# Altium schematic sheet DebugBoard5VMux.SchDoc
size 420 x 297 mm; SheetNumber: 2; SheetTotal: 2
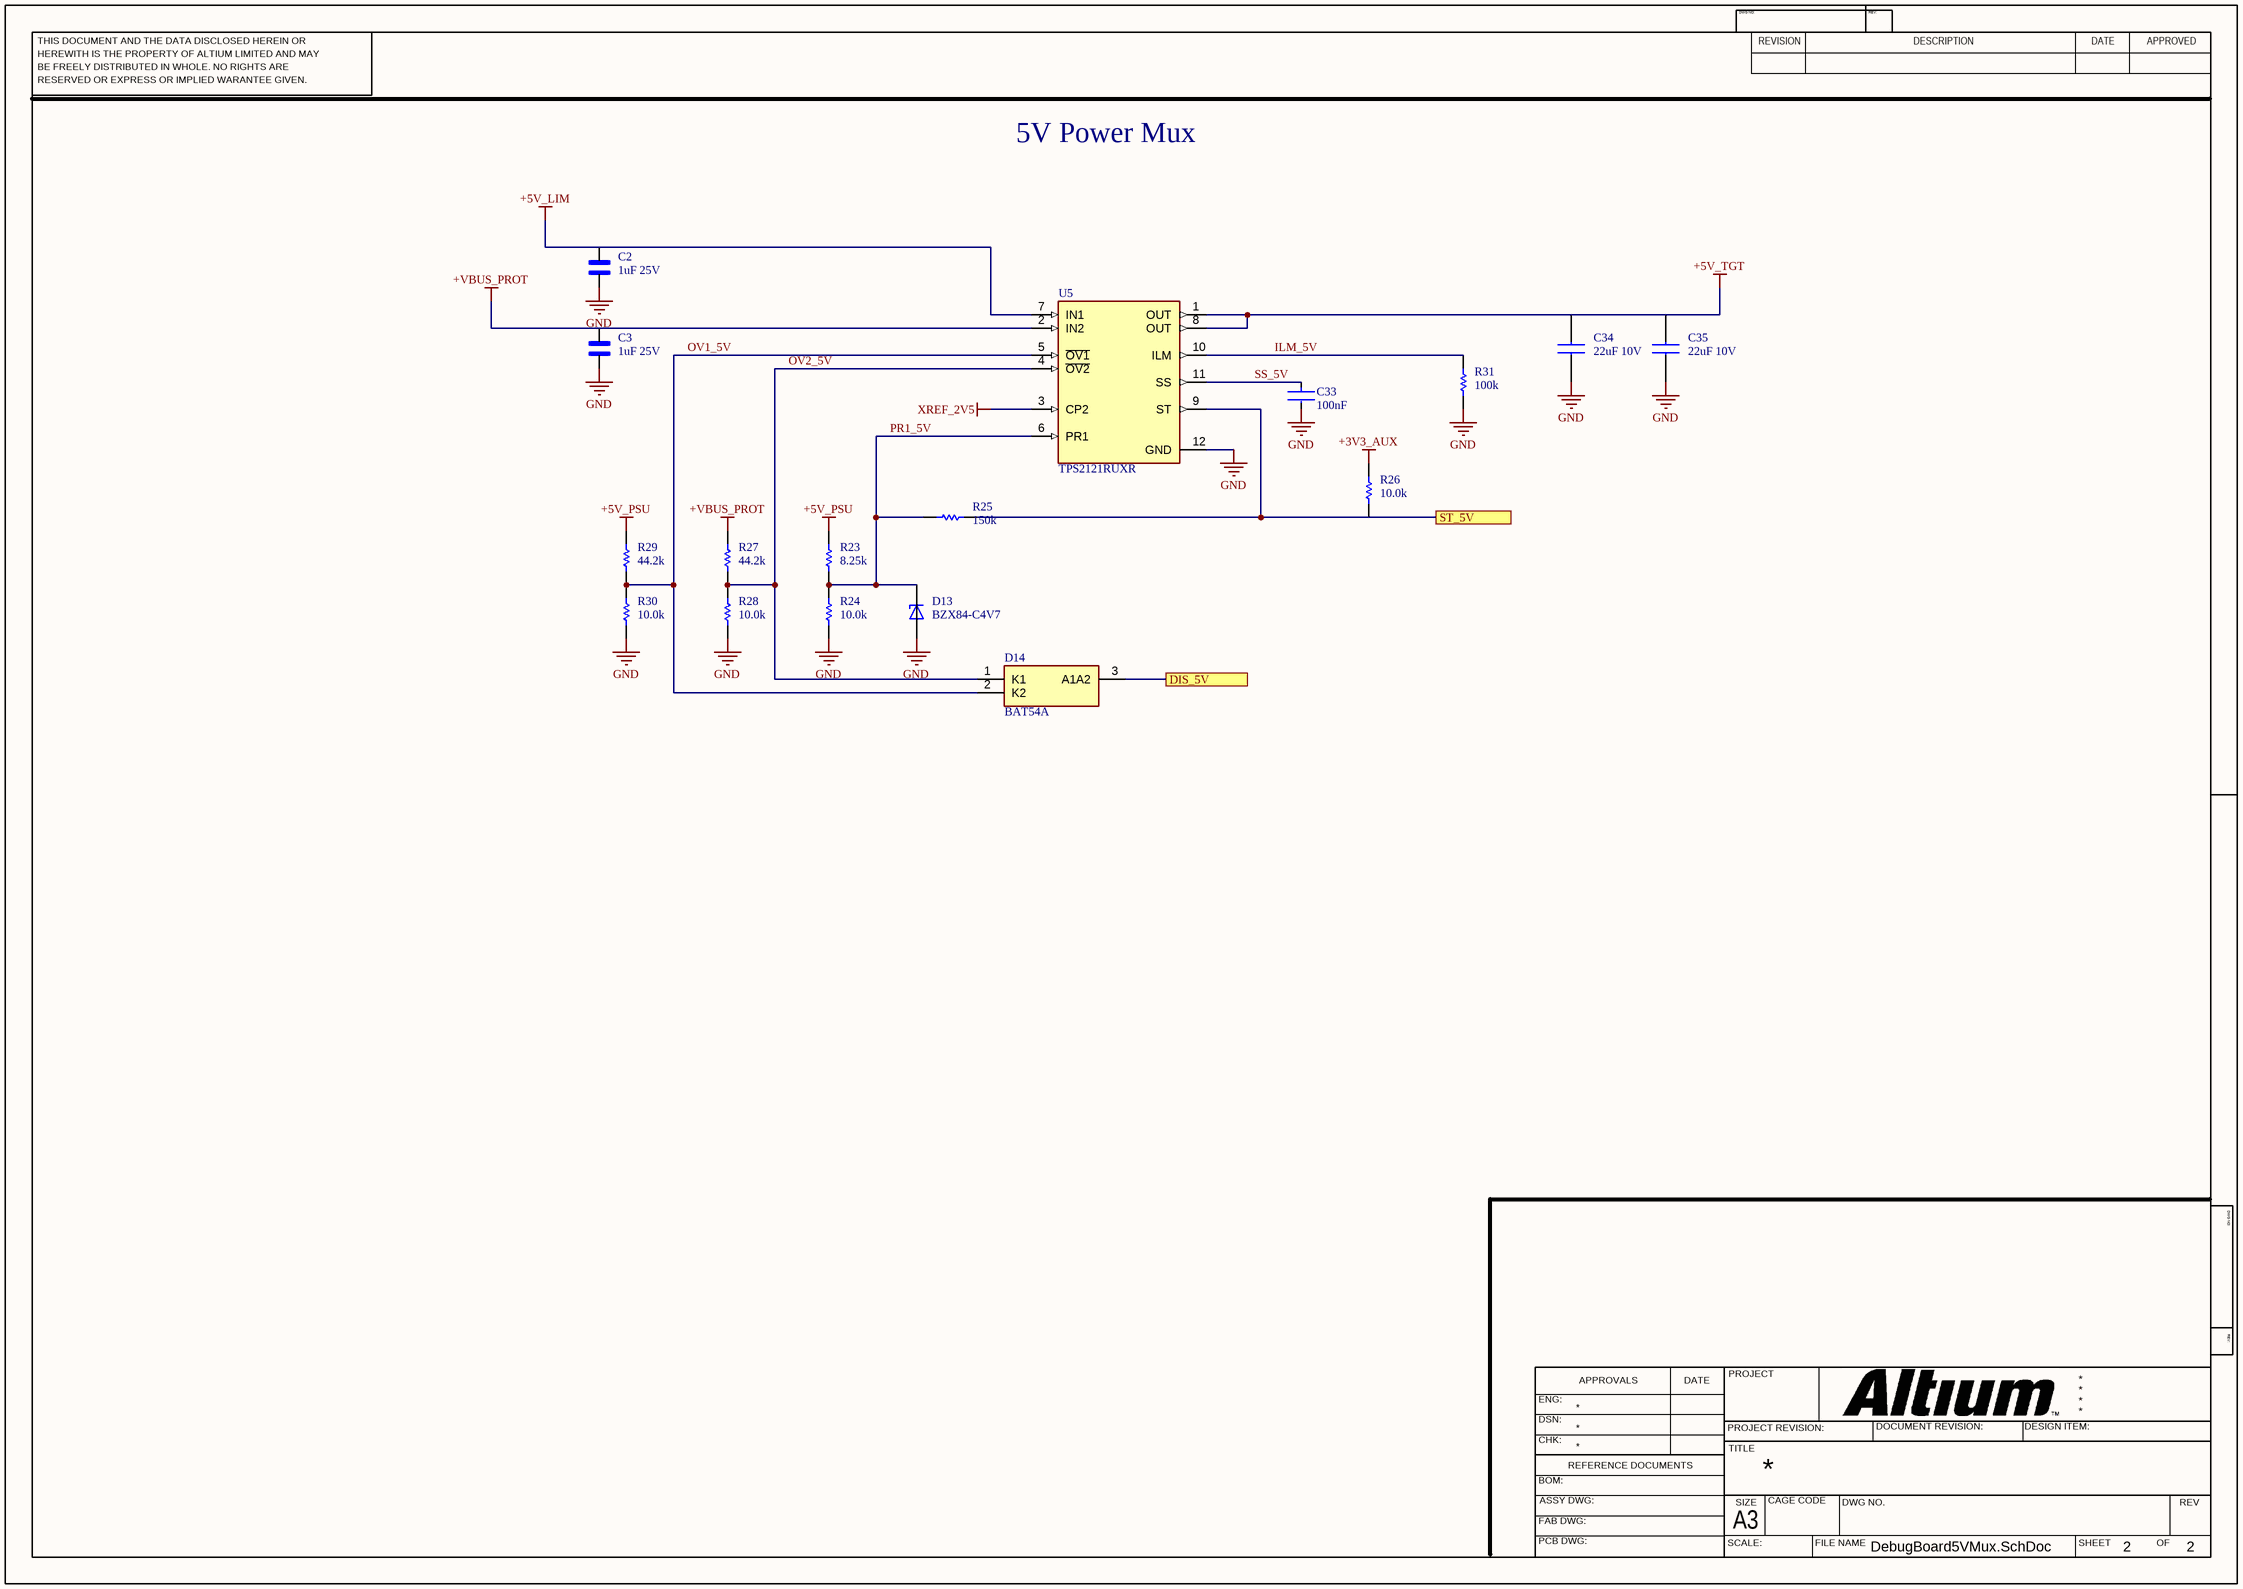
[diagram p0: DebugBoard5VMux.SchDoc]

## Parts
C2  1uF 25V  [CAPC2012X135N]
C3  1uF 25V  [CAPC2012X135N]
C33  100nF  [FP-C0805C-DN-MFG]
C34  22uF 10V  [CAPC3116X180N]
C35  22uF 10V  [CAPC3116X180N]
D13  BZX84-C4V7  [SOT95P230X110-3N]
D14  BAT54A  [SOT95P230X110-3N]
R23  8.25k  [RES_0805]
R24  10.0k  [RES_0805]
R25  150k  [RES_0805]
R26  10.0k  [RES_0805]
R27  44.2k  [RES_0805]
R28  10.0k  [RES_0805]
R29  44.2k  [RES_0805]
R30  10.0k  [RES_0805]
R31  100k  [RES_0805]
U5  TPS2121RUXR  [FP-RUX0012A-MFG]

## Ports
DIS_5V, ST_5V

## Nets
+3V3_AUX: R26.2
+5V_LIM: C2.1 U5.7(IN1)
+5V_PSU: R23.1 R29.1
+5V_TGT: C34.1 C35.1 U5.1(OUT) U5.8(OUT)
+VBUS_PROT: C3.1 R27.1 U5.2(IN2)
GND: C2.2 C3.2 C33.2 C34.2 C35.2 D13.1(A) R24.2 R28.2 R30.2 R31.2 U5.12(GND)
XREF_2V5: U5.3(CP2)
DIS_5V: D14.3(A1A2) ; port DIS_5V
ILM_5V: R31.1 U5.10(ILM)
OV1_5V: D14.2(K2) R29.2 R30.1 U5.5(~{OV1})
OV2_5V: D14.1(K1) R27.2 R28.1 U5.4(~{OV2})
PR1_5V: D13.3(C) R23.2 R24.1 R25.1 U5.6(PR1)
SS_5V: C33.1 U5.11(SS)
ST_5V: R25.2 R26.1 U5.9(ST) ; port ST_5V

## Notes on the sheet
- 5V Power Mux
- THIS DOCUMENT AND THE DATA DISCLOSED HEREIN OR
- HEREWITH IS THE PROPERTY OF ALTIUM LIMITED AND MAY
- DWG NO:
- REVISION
- REV:
- DESCRIPTION
- DATE
- APPROVED
- BE FREELY DISTRIBUTED IN WHOLE. NO RIGHTS ARE
- RESERVED OR EXPRESS OR IMPLIED WARANTEE GIVEN.
- ENG:
- APPROVALS
- PROJECT
- DSN:
- CHK:
- REFERENCE DOCUMENTS
- PROJECT REVISION:
- TITLE
- DOCUMENT REVISION:
- DESIGN ITEM:
- BOM:
- FAB DWG:
- PCB DWG:
- ASSY DWG:
- SCALE:
- A3
- SIZE
- CAGE CODE
- FILE NAME
- DWG NO.
- SHEET
- OF
- REV

## Library data of the parts
C2 C3 = CL21B105KAFNNNE: 1 ÂµF Â±10% 25V Ceramic Capacitor X7R 0805 (2012 Metric); MF: Samsung Electro-Mechanics; SnapEDA_Link: https://www.snapeda.com/parts/CL21B105KAFNNNE/Samsung/view-part/?ref=snap; Package: SMD-2 Samsung; Value: 1uF 25V; MP: CL21B105KAFNNNE; Check_prices: https://www.snapeda.com/parts/CL21B105KAFNNNE/Samsung/view-part/?ref=eda
C33 = CMP-03020-000950-1: CAP CER 0.1UF 50V X7R 0805; Manufacturer: KEMET; Manufacturer Part Number: C0805C104J5RACTU; Temperature Coefficient: 30ppm/°C; Value: 0.10 μF; Material: Ceramic; Tolerance: 0.05; Voltage Rating: 50 V; Digikey Description: CAP CER 0.1UF 50V X7R 0805; Octopart: https://octopart.com/c0805c104j5ractu-kemet-104634; RoHS: TRUE; Device Class L1: Passive Components; Temperature Characteristic: X7R; Device Class L3: Ceramic Capacitors; Lead Free: Yes; Automotive: No; Category: Cap; Temperature: -55°C to +125°C; Package: C0805C-DN; Temperature Range High: +125°C; Height: 0.88mm; Capacitance: 0.10 μF; Temperature Range Low: -55°C; ComponentLink2Description: Datasheet; ComponentLink2URL: https://content.kemet.com/datasheets/KEM_C1003_C0G_SMD.pdf; Ipc Land Pattern Name: CAPC200125X78; Device Class L2: Capacitors; Mouser Description: Multilayer Ceramic Capacitors MLCC - SMD/SMT 50volts 0.1uF X7R 5%
C34 C35 = GCM31CR71A226KE02K: Capacitor GCM31 L=3.2mm W=1.6mm T=1.6mm; Manufacturer_Name: Murata Electronics; Geometry.Height: 1.8mm; Manufacturer_Part_Number: GCM31CR71A226KE02K; Mouser Part Number: 81-GCM31CR71A226KE2K; Mouser Price/Stock: https://www.mouser.co.uk/ProductDetail/Murata-Electronics/GCM31CR71A226KE02K?qs=QzBtWTOodeVgM6QlH6X51g%3D%3D; Arrow Part Number: GCM31CR71A226KE02K; Arrow Price/Stock: https://www.arrow.com/en/products/gcm31cr71a226ke02k/murata-manufacturing?region=nac; Datasheet Link: https://search.murata.co.jp/Ceramy/image/img/A01X/G101/ENG/GCM31CR71A226KE02-01A.pdf
D13 = BZX84-C4V7,215: MF: {'manufacturer': u'Nexperia USA Inc.'}; Package: None; Price: None; Value: BZX84-C4V7; MP: BZX84-C4V7,215; Availability: Unavailable
D14 = BAT54A_215: Diode Array 1 Pair Common Anode 30 V 200mA (DC) Surface Mount TO-236-3, SC-59, SOT-23-3; Manufacturer_Name: Nexperia; Manufacturer_Part_Number: BAT54A,215; Geometry.Height: 1.1mm; Mouser Part Number: 771-BAT54A-T/R; Mouser Price/Stock: https://www.mouser.co.uk/ProductDetail/Nexperia/BAT54A215?qs=me8TqzrmIYV%252BITv%2F8aeieg%3D%3D; Arrow Part Number: BAT54A,215; Arrow Price/Stock: https://www.arrow.com/en/products/bat54a215/nexperia.html?utm_currency=USD&region=europe; Datasheet Link: https://assets.nexperia.com/documents/data-sheet/BAT54A.pdf
R23-R31 = CMP-009-00183-1: Resistor SMD 0805 - Generic; Source: Generic_Schematic_Library.SchLib; Design Item ID: RES_0805
U5 = CMP-019-00076-1: 2.7-V to 22-V, 56-mΩ, 4.5-A, power mux with seamless switchover 12-VQFN-HR -40 to 125; Min Supply Voltage: 2.8V; Max Supply Voltage: 22V; Nominal Supply Current: 300µA; Max Operating Temperature: 125°C; Output Voltage: 22V; Pins: 12; Min Operating Temperature: -40°C